# EAGLE design proto1-a (EAGLE 4.13)
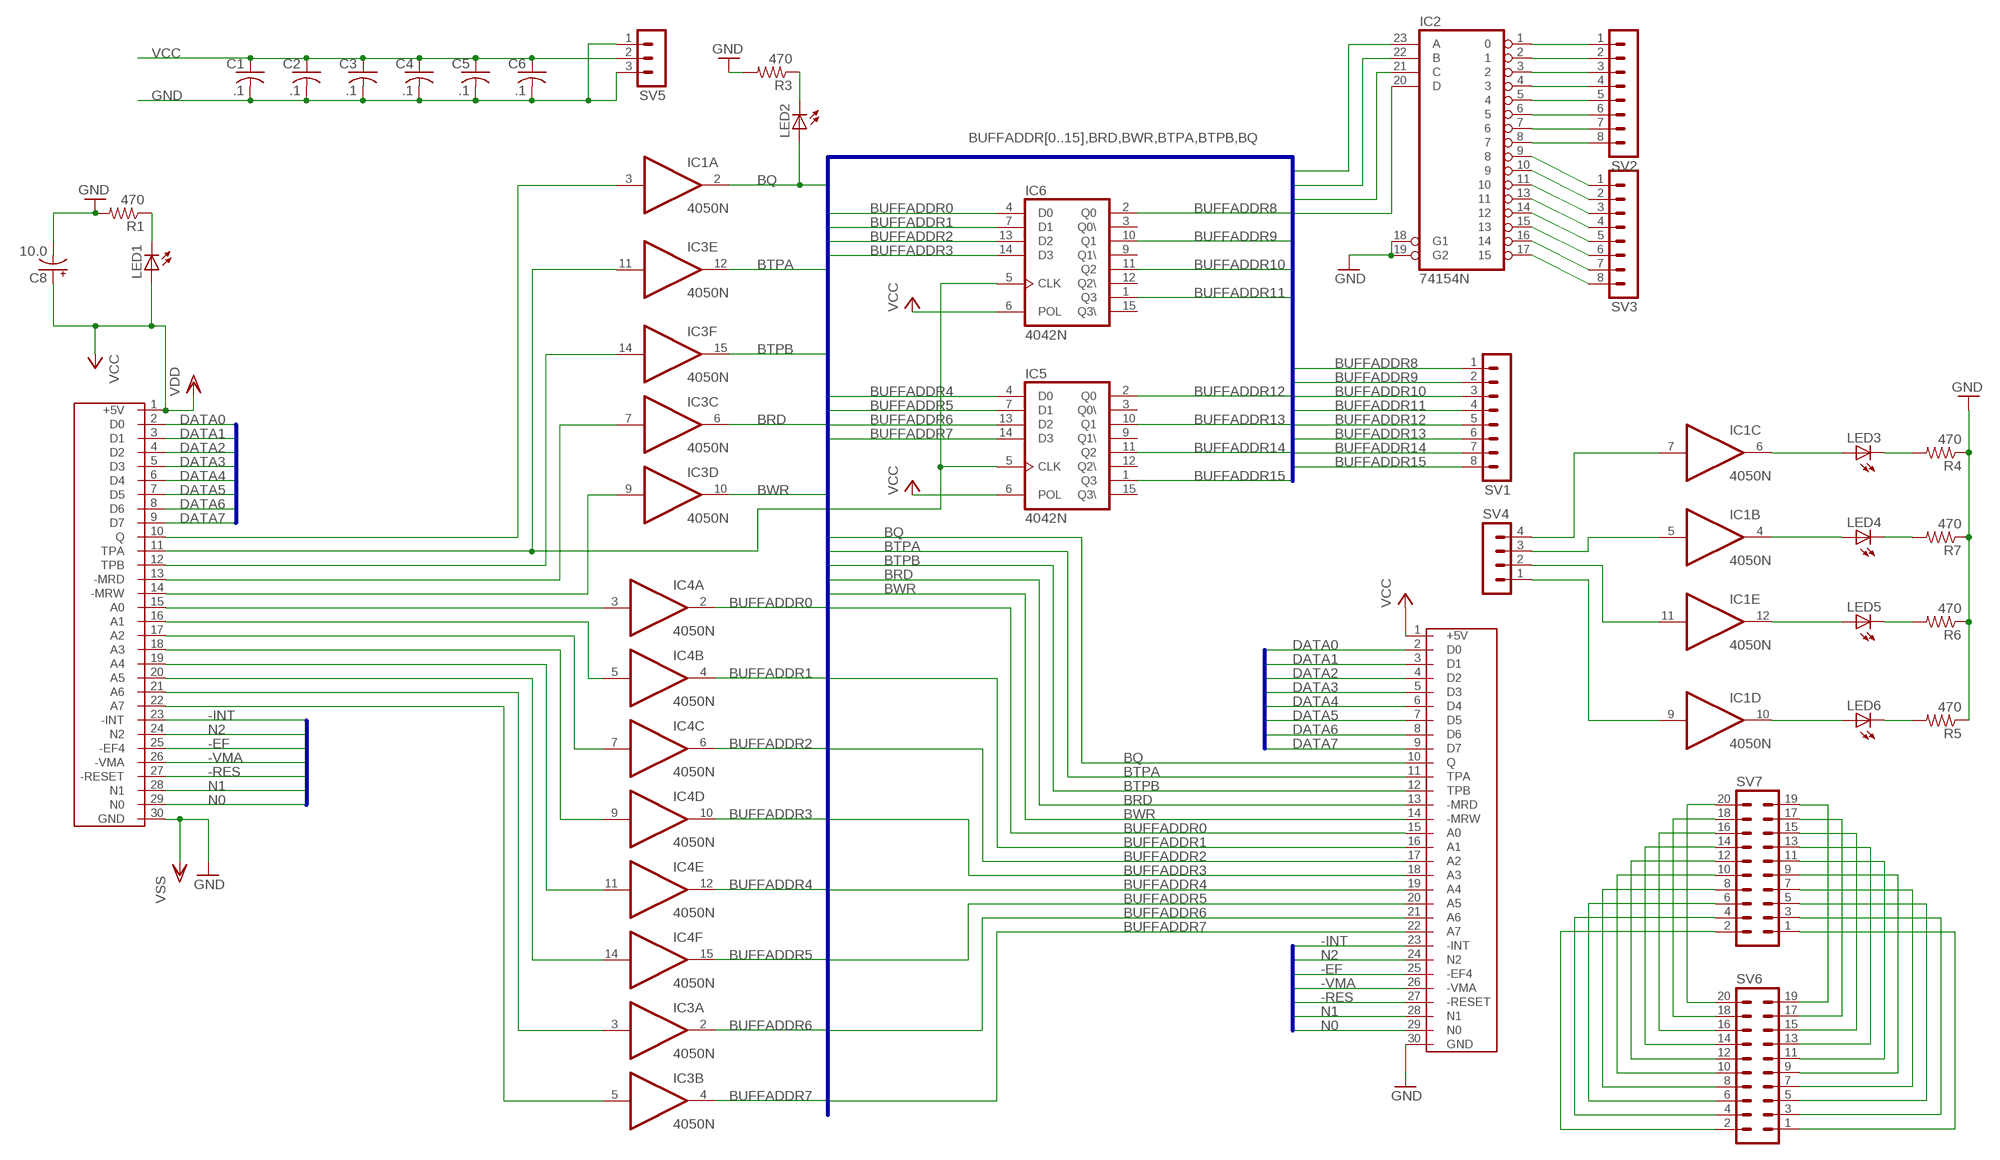
[diagram p0: schematic, sheet 1]

## Parts
C1  .1  C-US025-050X050  [C025-050X050]
C2  .1  C-US025-050X050  [C025-050X050]
C3  .1  C-US025-050X050  [C025-050X050]
C4  .1  C-US025-050X050  [C025-050X050]
C5  .1  C-US025-050X050  [C025-050X050]
C6  .1  C-US025-050X050  [C025-050X050]
C8  10.0  CPOL-USE2.5-7  [E2,5-7]
IC1  4050N  [DIL16]
IC2  74154N  [DIL24-6]
IC3  4050N  [DIL16]
IC4  4050N  [DIL16]
IC5  4042N  [DIL16]
IC6  4042N  [DIL16]
LED1  LED5MM  [LED5MM]
LED2  LED5MM  [LED5MM]
LED3  LED5MM  [LED5MM]
LED4  LED5MM  [LED5MM]
LED5  LED5MM  [LED5MM]
LED6  LED5MM  [LED5MM]
R1  470  R-US_0207/7  [0207/7]
R3  470  R-US_0207/7  [0207/7]
R4  470  R-US_0207/7  [0207/7]
R5  470  R-US_0207/7  [0207/7]
R6  470  R-US_0207/7  [0207/7]
R7  470  R-US_0207/7  [0207/7]
SV1  MA08-1  [MA08-1]
SV2  MA08-1  [MA08-1]
SV3  MA08-1  [MA08-1]
SV4  MA04-1  [MA04-1]
SV5  MA03-1  [MA03-1]
SV6  MA10-2  [MA10-2]
SV7  MA10-2  [MA10-2]
U$1  C30  [C30]
U$2  C30  [C30]

## Nets
-EF: U$1.25(-EF4) U$2.25(-EF4)
-INT: U$1.23(-INT) U$2.23(-INT)
-RES: U$1.27(-RESET) U$2.27(-RESET)
-VMA: U$1.26(-VMA) U$2.26(-VMA)
ADDR0: IC4.3(A:I) U$1.15(A0)
ADDR1: IC4.5(B:I) U$1.16(A1)
ADDR2: IC4.7(C:I) U$1.17(A2)
ADDR3: IC4.9(D:I) U$1.18(A3)
ADDR4: IC4.11(E:I) U$1.19(A4)
ADDR5: IC4.14(F:I) U$1.20(A5)
ADDR6: IC3.3(A:I) U$1.21(A6)
ADDR7: IC3.5(B:I) U$1.22(A7)
BQ: IC1.2(A:O) LED2.A U$2.10(Q)
BRD: IC3.6(C:O) U$2.13(-MRD)
BTPA: IC3.12(E:O) U$2.11(TPA)
BTPB: IC3.15(F:O) U$2.12(TPB)
BUFFADDR0: IC4.2(A:O) IC6.4(D0) U$2.15(A0)
BUFFADDR1: IC4.4(B:O) IC6.7(D1) U$2.16(A1)
BUFFADDR2: IC4.6(C:O) IC6.13(D2) U$2.17(A2)
BUFFADDR3: IC4.10(D:O) IC6.14(D3) U$2.18(A3)
BUFFADDR4: IC4.12(E:O) IC5.4(D0) U$2.19(A4)
BUFFADDR5: IC4.15(F:O) IC5.7(D1) U$2.20(A5)
BUFFADDR6: IC3.2(A:O) IC5.13(D2) U$2.21(A6)
BUFFADDR7: IC3.4(B:O) IC5.14(D3) U$2.22(A7)
BUFFADDR8: IC6.2(Q0) SV1.1
BUFFADDR9: IC6.10(Q1) SV1.2
BUFFADDR10: IC6.11(Q2) SV1.3
BUFFADDR11: IC6.1(Q3) SV1.4
BUFFADDR12: IC2.23(A) IC5.2(Q0) SV1.5
BUFFADDR13: IC2.22(B) IC5.10(Q1) SV1.6
BUFFADDR14: IC2.21(C) IC5.11(Q2) SV1.7
BUFFADDR15: IC2.20(D) IC5.1(Q3) SV1.8
BWR: IC3.10(D:O) U$2.14(-MRW)
DATA0: U$1.2(D0) U$2.2(D0)
DATA1: U$1.3(D1) U$2.3(D1)
DATA2: U$1.4(D2) U$2.4(D2)
DATA3: U$1.5(D3) U$2.5(D3)
DATA4: U$1.6(D4) U$2.6(D4)
DATA5: U$1.7(D5) U$2.7(D5)
DATA6: U$1.8(D6) U$2.8(D6)
DATA7: U$1.9(D7) U$2.9(D7)
GND: C1.2 C2.2 C3.2 C4.2 C5.2 C6.2 C8.- IC2.18(G1) IC2.19(G2) R1.2 R3.2 R4.1 R5.1 R6.1 R7.1 SV5.1 SV5.3 U$1.30(GND) U$2.30(GND) ; supply symbol labelled VSS
N0: U$1.29(N0) U$2.29(N0)
N1: U$1.28(N1) U$2.28(N1)
N2: U$1.24(N2) U$2.24(N2)
N$1: IC1.3(A:I) U$1.10(Q)
N$2: IC2.6 SV2.6
N$3: IC2.7 SV2.7
N$4: IC2.1 SV2.1
N$5: IC2.2 SV2.2
N$6: IC2.3 SV2.3
N$7: IC2.4 SV2.4
N$8: IC2.5 SV2.5
N$9: IC2.8 SV2.8
N$10: IC2.9 SV3.1
N$11: IC3.11(E:I) IC5.5(CLK) IC6.5(CLK) U$1.11(TPA)
N$12: IC3.14(F:I) U$1.12(TPB)
N$13: IC3.7(C:I) U$1.13(-MRD)
N$14: IC3.9(D:I) U$1.14(-MRW)
N$15: IC2.10 SV3.2
N$16: IC2.11 SV3.3
N$17: IC2.13 SV3.4
N$18: IC2.14 SV3.5
N$19: IC2.15 SV3.6
N$20: IC2.16 SV3.7
N$21: IC2.17 SV3.8
N$22: LED1.K(C) R1.1
N$23: LED2.K(C) R3.1
N$24: IC1.6(C:O) LED3.A
N$25: LED3.K(C) R4.2
N$26: LED4.K(C) R7.2
N$27: IC1.4(B:O) LED4.A
N$28: IC1.12(E:O) LED5.A
N$29: LED5.K(C) R6.2
N$30: IC1.10(D:O) LED6.A
N$31: LED6.K(C) R5.2
N$32: IC1.7(C:I) SV4.4
N$33: IC1.5(B:I) SV4.3
N$34: IC1.11(E:I) SV4.2
N$35: IC1.9(D:I) SV4.1
N$36: SV6.19 SV7.19
N$37: SV6.17 SV7.17
N$38: SV6.15 SV7.15
N$39: SV6.13 SV7.13
N$40: SV6.11 SV7.11
N$41: SV6.5 SV7.5
N$42: SV6.9 SV7.9
N$43: SV6.7 SV7.7
N$44: SV6.3 SV7.3
N$45: SV6.1 SV7.1
N$46: SV6.20 SV7.20
N$47: SV6.18 SV7.18
N$48: SV6.16 SV7.16
N$49: SV6.14 SV7.14
N$50: SV6.12 SV7.12
N$51: SV6.10 SV7.10
N$52: SV6.8 SV7.8
N$53: SV6.6 SV7.6
N$54: SV6.4 SV7.4
N$55: SV6.2 SV7.2
VCC: C1.1 C2.1 C3.1 C4.1 C5.1 C6.1 C8.+ IC5.6(POL) IC6.6(POL) LED1.A SV5.2 U$1.1(+5V) U$2.1(+5V) ; supply symbol labelled VDD
Unconnected: IC1.14(F:I) IC1.15(F:O) IC5.3(Q0\) IC5.9(Q1\) IC5.12(Q2\) IC5.15(Q3\) IC6.3(Q0\) IC6.9(Q1\) IC6.12(Q2\) IC6.15(Q3\)

## Buses
BUFFADDR[0..15],BRD,BWR,BTPA,BTPB,BQ
DATA[0..7]
-INT,N0,N1,N2,-EF,-VMA,-RES,-VMA

## Power pins joined to a net without a drawn wire
GND: IC2.12(GND)
VCC: IC2.24(VCC)
VDD: IC1.1(P:VDD) IC3.1(P:VDD) IC4.1(P:VDD) IC5.16(VDD) IC6.16(VDD)
VSS: IC1.8(P:VSS) IC3.8(P:VSS) IC4.8(P:VSS) IC5.8(VSS) IC6.8(VSS)

## Library data of the parts
C1-C6 = rcl:C-US: CAPACITOR, American symbol
C8 = rcl:CPOL-US: POLARIZED CAPACITOR, American symbol
IC1 IC3 IC4 = 40xx:4050: Hex non-inverting BUFFER
IC2 = 74xx-us:74*154: 4-line to 16-line data SELECTOR/MULTIPLEXER
IC5 IC6 = 40xx:4042: Quad clocked D LATCH
LED1-LED6 = led:LED: LED OSRAM: - CHIPLED LG R971, LG N971, LY N971, LG Q971, LY Q971, LO R971, LY R971 LH N974, LH R974 LS Q976, LO Q976, LY Q976 LO Q996 - Hyper CHIPLED LW Q18S LB Q993, LB Q99A, LB R99A - SideLED LS A670, LO A670, LY A670, LG A670, LP A670 LB A673, LV A673, LT A673, LW A673 LH A674 LY A675 LS A676, LA A676, LO A676, LY A676, LW A676 LS A679, LY A679, LG A679 - Hyper Micro SIDELED® LS Y876, LA Y876, LO Y876, LY Y876 LT Y87S - SmartLED LW L88C, LW L88S LB L89C, LB L89S, LG L890 LS L89K, LO L89K, LY L89K LS L896, LA L896, LO L896, LY L896 - TOPLED LS T670, LO T670, LY T670, LG T670, LP T670 LSG T670, LSP T670, LSY T670, LOP T670, LYG T670 LG T671, LOG T671, LSG T671 LB T673, LV T673, LT T673, LW T673 LH T674 LS T676, LA T676, LO T676, LY T676, LB T676, LH T676, LSB T676, LW T676 LB T67C, LV T67C, LT T67C, LS T67K, LO T67K, LY T67K, LW E67C LS E67B, LA E67B, LO E67B, LY E67B, LB E67C, LV E67C, LT E67C LW T67C LS T679, LY T679, LG T679 LS T770, LO T770, LY T770, LG T770, LP T770 LB T773, LV T773, LT T773, LW T773 LH T774 LS E675, LA E675, LY E675, LS T675 LS T776, LA T776, LO T776, LY T776, LB T776 LHGB T686 LT T68C, LB T68C - Hyper Mini TOPLED® LB M676 - Mini TOPLED Santana® LG M470 LS M47K, LO M47K, LY M47K Source: http://www.osram.convergy.de/
R1 R3-R7 = rcl:R-US_: RESISTOR, American symbol
SV1-SV3 = con-lstb:MA08-1: PIN HEADER
SV4 = con-lstb:MA04-1: PIN HEADER
SV5 = con-lstb:MA03-1: PIN HEADER
SV6 SV7 = con-lstb:MA10-2: PIN HEADER
U$1 U$2 = k1:C30

## Board
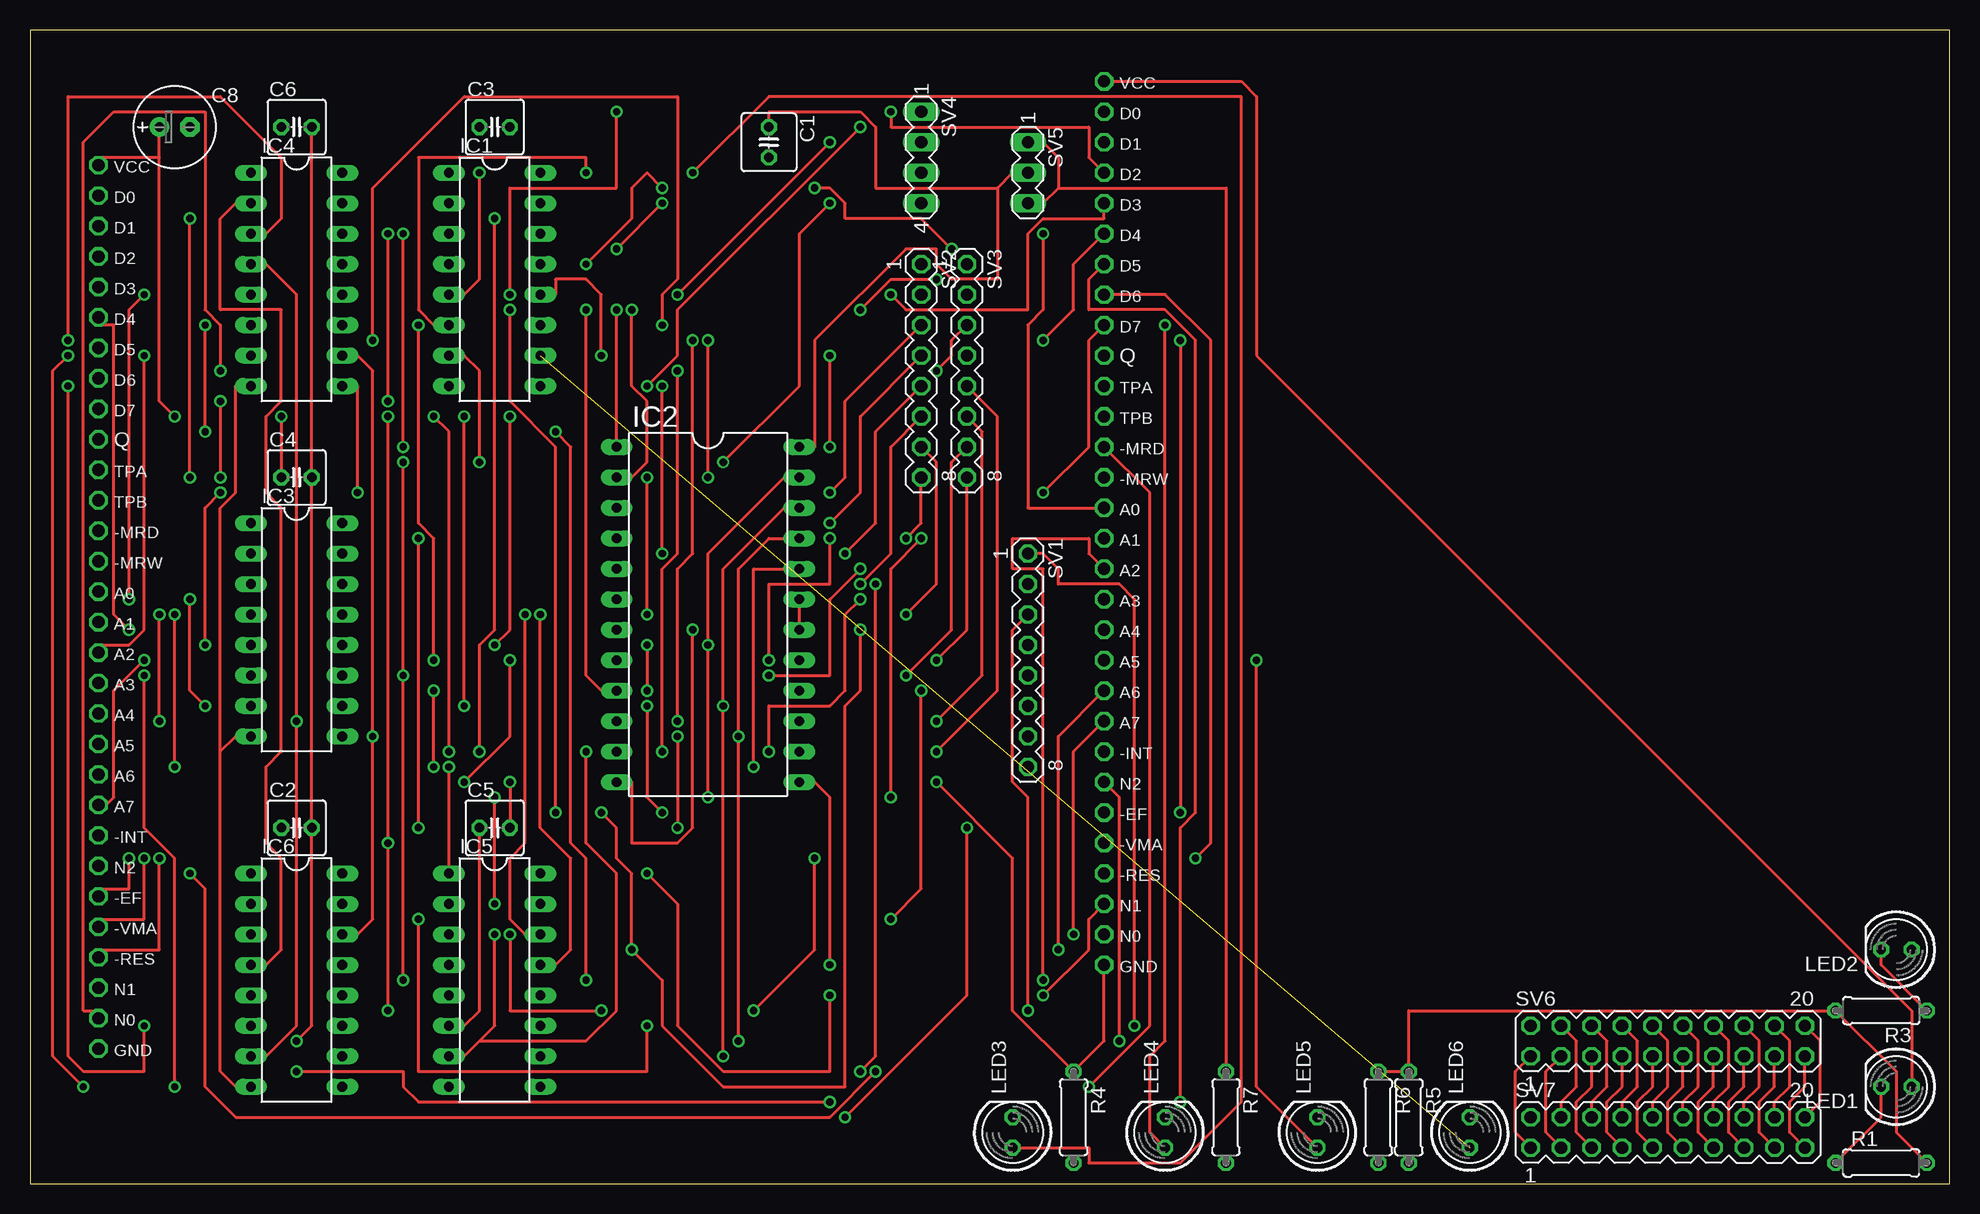
[diagram p1: board, top side]
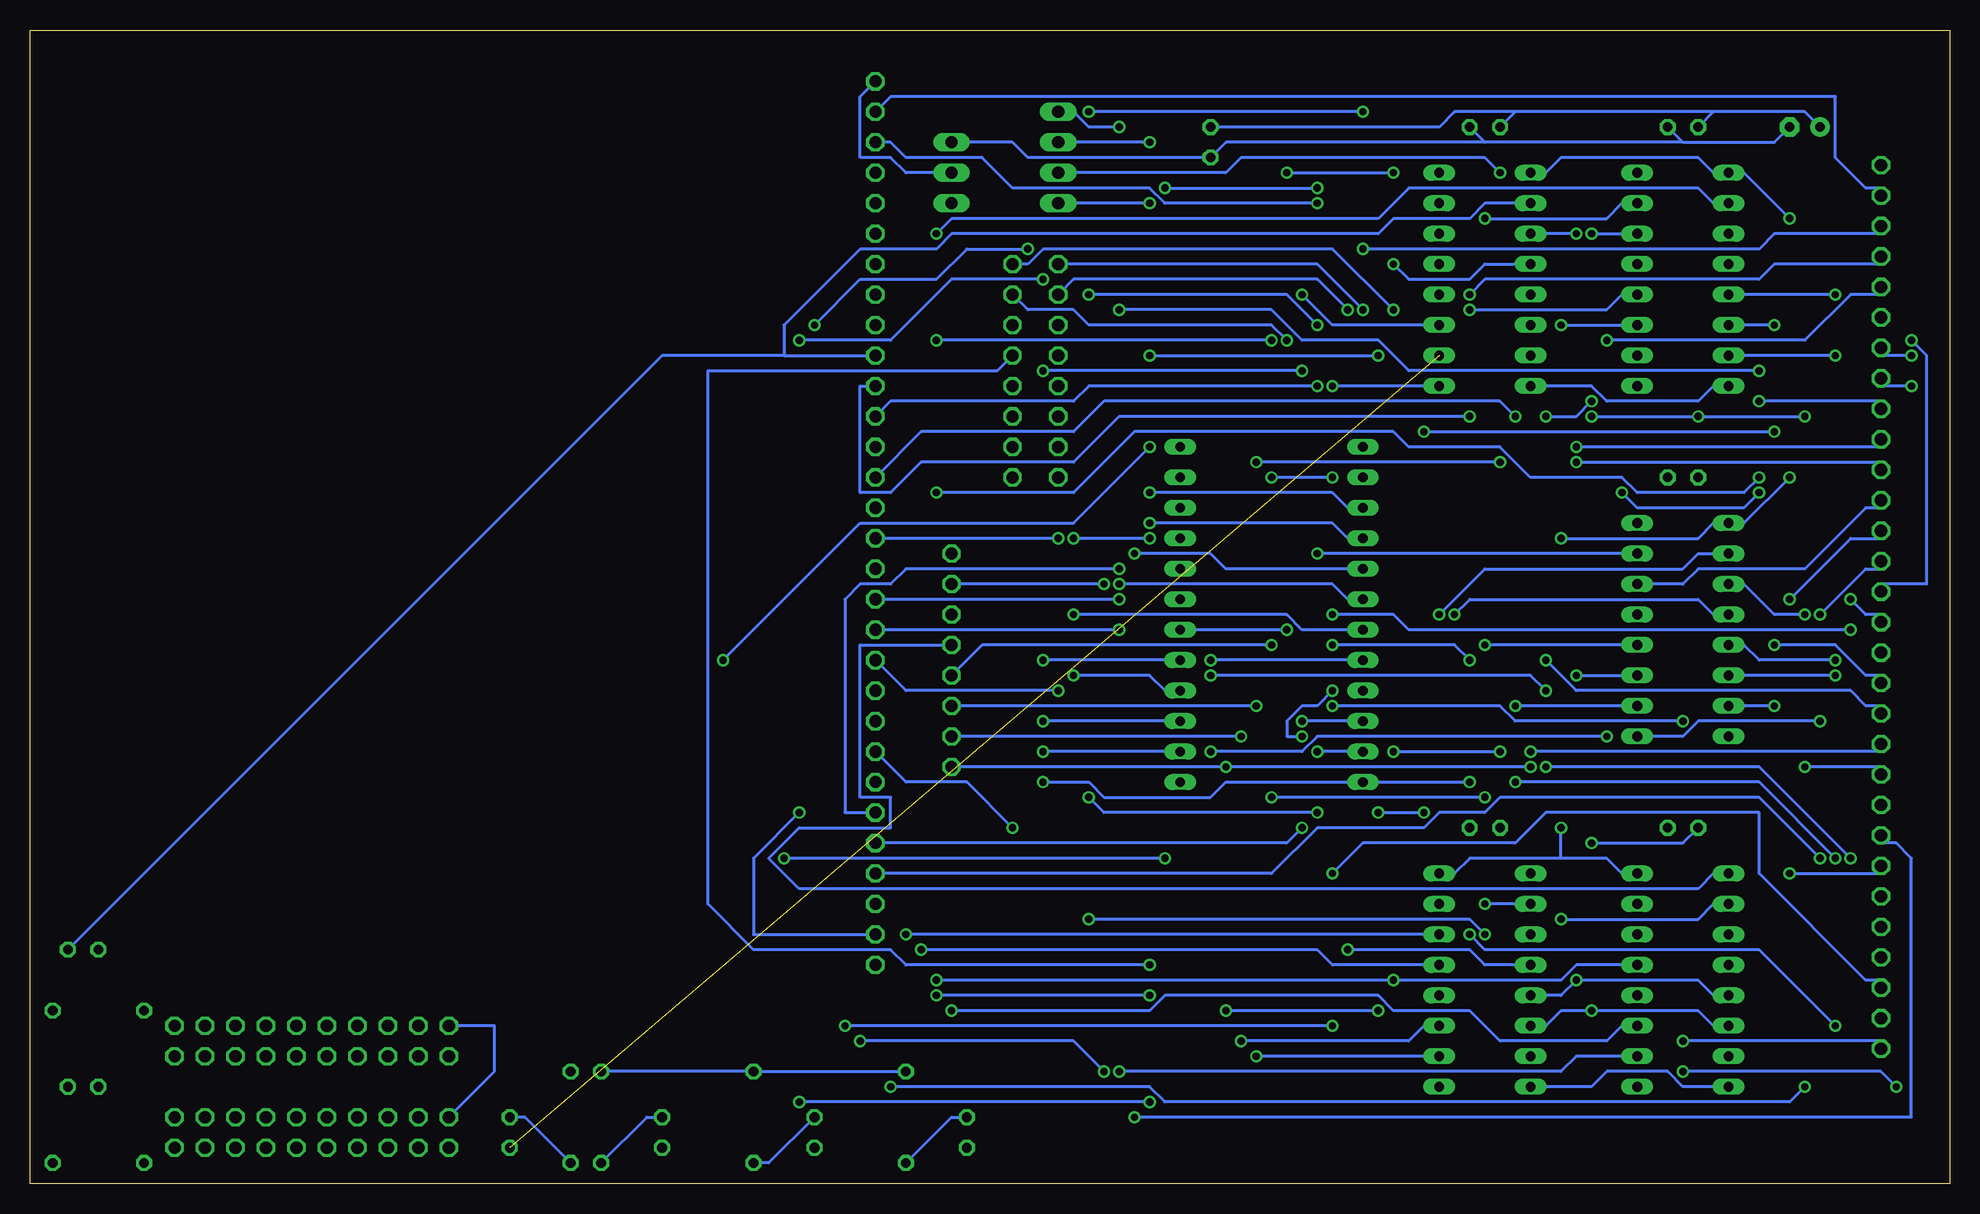
[diagram p2: board, bottom side, seen from below]

Size 160 x 96.19 mm. Coordinates in mm from the lower left corner, seen from the top.
Outline: 0,0 160,0 160,96.19 0,96.19 0,0
Copper layers (1*16): Top 0.035mm / dielectric 1.5mm / Bottom 0.035mm
Design rules "default": minimum track width 10mil, minimum drill 24mil, track to track 8mil, track to pad 8mil, pad to pad 8mil, via to via 8mil, smd to smd 8mil, copper to edge 40mil, drill to drill 8mil, minimum pad ring 10mil, minimum via ring 8mil, stop-mask expansion 4mil, vias tented up to drill 0mil, thermal gap 10mil
tRestrict: area 0.6,91.9 to 76.8,95.7; area 0.6,0.5 to 76.8,4.3
bRestrict: area 0.6,91.9 to 76.8,95.7; area 0.6,0.5 to 76.8,4.3

### Footprints (pad centres in the part's own frame; a part is rotated, then mirrored left to right if it is on the bottom)
C025-050X050 = drill 0.813 octagon: 1 -1.27,0; 2 1.27,0
E2,5-7 = drill 0.813 pad 1.6 round: + -1.27,0 | drill 0.813 pad 1.6 octagon: - 1.27,0
DIL16 = drill 0.813 long: 1 -8.89,-3.81; 2 -6.35,-3.81; 3 -3.81,-3.81; 4 -1.27,-3.81; 5 1.27,-3.81; 6 3.81,-3.81; 7 6.35,-3.81; 8 8.89,-3.81; 9 8.89,3.81; 10 6.35,3.81; 11 3.81,3.81; 12 1.27,3.81; 13 -1.27,3.81; 14 -3.81,3.81; 15 -6.35,3.81; 16 -8.89,3.81
DIL24-6 = drill 0.813 long: 1 -13.97,-7.62; 2 -11.43,-7.62; 3 -8.89,-7.62; 4 -6.35,-7.62; 5 -3.81,-7.62; 6 -1.27,-7.62; 7 1.27,-7.62; 8 3.81,-7.62; 9 6.35,-7.62; 10 8.89,-7.62; 11 11.43,-7.62; 12 13.97,-7.62; 13 13.97,7.62; 14 11.43,7.62; 15 8.89,7.62; 16 6.35,7.62; 17 3.81,7.62; 18 1.27,7.62; 19 -1.27,7.62; 20 -3.81,7.62; 21 -6.35,7.62; 22 -8.89,7.62; 23 -11.43,7.62; 24 -13.97,7.62
LED5MM = drill 0.813 octagon: A -1.27,0; K 1.27,0
0207/7 = drill 0.813 octagon: 1 -3.81,0; 2 3.81,0
MA08-1 = drill 1.016 octagon: 1 -8.89,0; 2 -6.35,0; 3 -3.81,0; 4 -1.27,0; 5 1.27,0; 6 3.81,0; 7 6.35,0; 8 8.89,0
MA04-1 = drill 1.016 long: 1 -3.81,0; 2 -1.27,0; 3 1.27,0; 4 3.81,0
MA03-1 = drill 1.016 long: 1 -2.54,0; 2 0,0; 3 2.54,0
MA10-2 = drill 1.016 octagon: 1 -11.43,-1.27; 2 -11.43,1.27; 3 -8.89,-1.27; 4 -8.89,1.27; 5 -6.35,-1.27; 6 -6.35,1.27; 7 -3.81,-1.27; 8 -3.81,1.27; 9 -1.27,-1.27; 10 -1.27,1.27; 11 1.27,-1.27; 12 1.27,1.27; 13 3.81,-1.27; 14 3.81,1.27; 15 6.35,-1.27; 16 6.35,1.27; 17 8.89,-1.27; 18 8.89,1.27; 19 11.43,-1.27; 20 11.43,1.27
C30 = drill 1.016 octagon: 1 -36.83,0; 2 -34.29,0; 3 -31.75,0; 4 -29.21,0; 5 -26.67,0; 6 -24.13,0; 7 -21.59,0; 8 -19.05,0; 9 -16.51,0; 10 -13.97,0; 11 -11.43,0; 12 -8.89,0; 13 -6.35,0; 14 -3.81,0; 15 -1.27,0; 16 1.27,0; 17 3.81,0; 18 6.35,0; 19 8.89,0; 20 11.43,0; 21 13.97,0; 22 16.51,0; 23 19.05,0; 24 21.59,0; 25 24.13,0; 26 26.67,0; 27 29.21,0; 28 31.75,0; 29 34.29,0; 30 36.83,0

### Placement (x,y rotation side)
C1  61.59,86.83 270 top
C2  22.22,29.68 0 top
C3  38.73,88.1 0 top
C4  22.22,58.89 0 top
C5  38.73,29.68 0 top
C6  22.22,88.1 0 top
C8  12.06,88.1 0 top
IC1  38.73,75.4 270 top
IC2  56.51,47.46 270 top
IC3  22.22,46.19 270 top
IC4  22.22,75.4 270 top
IC5  38.73,16.98 270 top
IC6  22.22,16.98 270 top
LED1  155.57,8.09 180 top
LED2  155.57,19.52 180 top
LED3  81.91,4.28 90 top
LED4  94.61,4.28 90 top
LED5  107.31,4.28 90 top
LED6  120.01,4.28 90 top
R1  154.3,1.74 0 top
R3  154.3,14.44 180 top
R4  86.99,5.55 270 top
R5  114.93,5.55 270 top
R6  112.39,5.55 270 top
R7  99.69,5.55 270 top
SV1  83.18,43.65 270 top
SV2  74.29,67.78 270 top
SV3  78.1,67.78 270 top
SV4  74.29,85.56 270 top
SV5  83.18,84.29 270 top
SV6  136.52,11.9 0 top
SV7  136.52,4.28 0 top
U$1  5.71,48.09 270 top
U$2  89.53,55.08 270 top

### Tracks (layer width: path | path; a pad name or v marks a point on that pad's centre or on a via)
-EF  (via drill 0.61)
  Top 0.254: v8.25,27.14 8.25,24.6 5.71,24.6 U$1.25 | v33.65,34.76 v33.65,41.11 | v61.59,42.38 66.67,42.38 66.67,48.73 v69.21,51.27
  Bottom 0.254: v8.25,27.14 15.87,34.76 v33.65,34.76 | v33.65,41.11 34.92,42.38 v61.59,42.38 | v69.21,51.27 86.99,51.27 88.26,50 90.8,50 92.07,48.73 92.07,30.95 U$2.25
-INT  (via drill 0.61)
  Top 0.254: v67.94,5.55 78.1,15.71 v78.1,29.68
  Bottom 0.254: v67.94,5.55 3.17,5.55 3.17,27.14 4.44,28.41 5.71,28.41 U$1.23 | v78.1,29.68 81.91,33.49 86.99,33.49 U$2.23
-RES  (via drill 0.61)
  Top 0.254: v10.79,27.14 10.79,19.52 5.71,19.52 U$1.27
  Bottom 0.254: v10.79,27.14 15.87,32.22 37.46,32.22 38.73,30.95 42.54,30.95 43.81,29.68 52.7,29.68 56.51,25.87 U$2.27
-VMA  (via drill 0.61)
  Top 0.254: v9.52,27.14 9.52,22.06 5.71,22.06 U$1.26 | v36.19,33.49 40,37.3 v40,43.65 | v51.43,44.92 v51.43,41.11 | v53.97,37.3 v53.97,29.68
  Bottom 0.254: v9.52,27.14 15.87,33.49 v36.19,33.49 | v40,43.65 41.27,44.92 v51.43,44.92 | v51.43,41.11 52.7,39.84 53.97,39.84 55.24,38.57 55.24,37.3 v53.97,37.3 | v53.97,29.68 55.24,28.41 U$2.26
ADDR0  (via drill 0.61)
  Top 0.254: v3.17,70.32 3.17,90.64 15.87,90.64 20.95,85.56 20.95,80.48 19.68,79.21 IC4.3
  Bottom 0.254: v3.17,70.32 1.9,69.05 1.9,50 5.71,50 U$1.15
ADDR1  (via drill 0.61)
  Top 0.254: v9.52,74.13 8.25,72.86 v8.25,48.73
  Bottom 0.254: v8.25,48.73 6.98,47.46 5.71,47.46 U$1.16 | v9.52,74.13 IC4.5
ADDR2  (via drill 0.61)
  Top 0.254: v9.52,69.05 9.52,46.19 8.25,44.92 5.71,44.92 U$1.17
  Bottom 0.254: v9.52,69.05 IC4.7
ADDR3  (via drill 0.61)
  Top 0.254: v27.3,57.62 27.3,66.51 IC4.9 | v15.87,57.62 14.6,56.35 v14.6,44.92
  Bottom 0.254: v27.3,57.62 26.03,56.35 17.14,56.35 v15.87,57.62 | v14.6,44.92 9.52,44.92 6.98,42.38 5.71,42.38 U$1.18
ADDR4  (via drill 0.61)
  Top 0.254: v32.38,71.59 32.38,55.08 33.65,53.81 v33.65,43.65
  Bottom 0.254: v33.65,43.65 31.11,41.11 8.25,41.11 6.98,39.84 5.71,39.84 U$1.19 | v32.38,71.59 IC4.11
ADDR5  (via drill 0.61)
  Top 0.254: v29.84,65.24 v29.84,79.21 | v33.65,63.97 34.92,62.7 v34.92,36.03
  Bottom 0.254: v29.84,65.24 31.11,63.97 v33.65,63.97 | v34.92,36.03 5.71,36.03 U$1.20 | v29.84,79.21 IC4.14
ADDR6  (via drill 0.61)
  Top 0.254: v12.06,34.76 v12.06,47.46
  Bottom 0.254: v12.06,47.46 14.6,47.46 17.14,50 IC3.3 | v12.06,34.76 5.71,34.76 U$1.21
ADDR7  (via drill 0.61)
  Top 0.254: v9.52,43.65 6.98,41.11 6.98,32.22 5.71,30.95 U$1.22
  Bottom 0.254: v9.52,43.65 15.87,43.65 17.14,44.92 IC3.5
BQ
  Bottom 0.254: 97.15,69.05 97.15,71.59 90.8,77.94 84.45,77.94 83.18,79.21 47.62,79.21 46.35,80.48 40,80.48 38.73,81.75 IC1.2 | 97.15,69.05 U$2.10 | LED2.A 107.31,69.05 97.15,69.05
BRD  (via drill 0.61)
  Top 0.254: v9.52,42.38 9.52,29.68 12.06,27.14 v12.06,8.09 | v88.26,8.09 93.34,13.17 93.34,57.62 U$2.13
  Bottom 0.254: v12.06,8.09 13.33,6.82 65.4,6.82 66.67,8.09 v88.26,8.09 | v9.52,42.38 IC3.6
BTPA  (via drill 0.61)
  Top 0.254: v38.73,44.92 40,46.19 v40,63.97
  Bottom 0.254: v40,63.97 69.21,63.97 73.02,60.16 85.72,60.16 88.26,57.62 90.8,57.62 90.8,66.51 U$2.11 | IC3.12 v38.73,44.92
BTPB  (via drill 0.61)
  Top 0.254: v52.7,52.54 v52.7,66.51
  Bottom 0.254: v52.7,66.51 71.75,66.51 73.02,65.24 88.26,65.24 U$2.12 | IC3.15 v52.7,52.54
BUFFADDR0  (via drill 0.61)
  Top 0.254: IC6.4 19.68,18.25 20.95,19.52 20.95,27.14 19.68,28.41 19.68,34.76 20.95,36.03 20.95,56.35 19.68,57.62 19.68,63.97 20.95,65.24 20.95,72.86 15.87,72.86 15.87,80.48 17.14,81.75 IC4.2 | U$2.15 83.18,56.35 83.18,71.59 84.45,72.86 v84.45,79.21
  Bottom 0.254: v84.45,79.21 83.18,80.48 47.62,80.48 45.08,83.02 20.95,83.02 19.68,81.75 IC4.2
BUFFADDR1  (via drill 0.61)
  Top 0.254: IC6.7 19.68,10.63 22.22,13.17 v22.22,38.57 22.22,74.13 19.68,76.67 IC4.4 | v74.29,53.81 71.75,51.27 v71.75,32.22 | v52.7,30.95 51.43,32.22 v51.43,39.84
  Bottom 0.254: v74.29,53.81 U$2.16 | v71.75,32.22 70.48,30.95 v52.7,30.95 | v51.43,39.84 37.46,39.84 36.19,38.57 v22.22,38.57
BUFFADDR2  (via drill 0.61)
  Top 0.254: v84.45,16.98 84.45,51.27 81.91,51.27 81.91,53.81 88.26,53.81 88.26,52.54 U$2.17 | v14.6,62.7 v14.6,71.59 | v43.81,62.7 45.08,61.43 45.08,28.41 46.35,27.14 v46.35,16.98
  Bottom 0.254: v84.45,16.98 v46.35,16.98 32.38,16.98 31.11,18.25 IC6.13 | v43.81,62.7 v14.6,62.7 | v14.6,71.59 IC4.6
BUFFADDR3  (via drill 0.61)
  Top 0.254: IC6.14 27.3,20.79 28.57,22.06 v28.57,37.3 28.57,67.78 27.3,69.05 IC4.10 | v69.21,48.73 67.94,47.46 67.94,41.11 66.67,39.84 61.59,39.84 v61.59,36.03
  Bottom 0.254: v69.21,48.73 U$2.18 | v61.59,36.03 53.97,36.03 52.7,37.3 v28.57,37.3
BUFFADDR4  (via drill 0.61)
  Top 0.254: v69.21,46.19 69.21,41.11 67.94,39.84 67.94,8.09 57.78,8.09 52.7,13.17 52.7,16.98 v50.16,19.52 50.16,25.87 48.89,27.14 48.89,29.68 v47.62,30.95 | v40,72.86 40,65.24 43.81,61.43 v43.81,30.95
  Bottom 0.254: v50.16,19.52 40,19.52 38.73,18.25 IC5.4 | v69.21,46.19 U$2.19 | v40,72.86 28.57,72.86 27.3,74.13 IC4.12 | v47.62,30.95 v43.81,30.95
BUFFADDR5  (via drill 0.61)
  Top 0.254: 37.46,11.9 38.73,13.17 v38.73,20.79 | 37.46,11.9 36.19,10.63 IC5.7 | v71.75,22.06 74.29,24.6 v74.29,41.11 | v38.73,80.48 38.73,46.19 37.46,44.92 v37.46,36.03 | v46.35,36.03 46.35,28.41 48.89,25.87 48.89,14.44 46.35,11.9 37.46,11.9
  Bottom 0.254: v38.73,20.79 40,22.06 v71.75,22.06 | v74.29,41.11 86.99,41.11 U$2.20 | v38.73,80.48 28.57,80.48 27.3,81.75 IC4.15 | v46.35,36.03 v37.46,36.03
BUFFADDR6  (via drill 0.61)
  Top 0.254: v42.54,47.46 42.54,29.68 45.08,27.14 45.08,19.52 43.81,18.25 IC5.13 | U$2.21 85.72,37.3 v85.72,19.52
  Bottom 0.254: v42.54,47.46 38.73,51.27 22.22,51.27 20.95,52.54 IC3.2 | v85.72,19.52 52.7,19.52 51.43,18.25 IC5.13
BUFFADDR7  (via drill 0.61)
  Top 0.254: v86.99,20.79 86.99,36.03 U$2.22 | v41.27,47.46 41.27,28.41 40,27.14 40,22.06 41.27,20.79 IC5.14
  Bottom 0.254: IC5.14 v86.99,20.79 | v41.27,47.46 40,48.73 20.95,48.73 19.68,47.46 IC3.4
BUFFADDR8  (via drill 0.61)
  Top 0.254: v32.38,22.06 32.38,9.36 51.43,9.36 v51.43,13.17 | v92.07,13.17 92.07,48.73 90.8,50 85.72,50 85.72,51.27 84.45,52.54 SV1.1
  Bottom 0.254: v32.38,22.06 20.95,22.06 19.68,23.33 IC6.2 | v51.43,13.17 v92.07,13.17
BUFFADDR9  (via drill 0.61)
  Top 0.254: v69.21,9.36 70.48,10.63 v70.48,50
  Bottom 0.254: v69.21,9.36 32.38,9.36 31.11,10.63 IC6.10 | v70.48,50 SV1.2
BUFFADDR10  (via drill 0.61)
  Top 0.254: v83.18,14.44 83.18,32.22 81.91,33.49 81.91,46.19 SV1.3
  Bottom 0.254: v83.18,14.44 66.67,14.44 65.4,15.71 47.62,15.71 46.35,14.44 40,14.44 37.46,11.9 28.57,11.9 27.3,13.17 IC6.11
BUFFADDR11
  Bottom 0.254: SV1.4 90.8,44.92 90.8,32.22 88.26,32.22 88.26,29.68 95.88,29.68 98.42,27.14 95.88,24.6 20.95,24.6 19.68,25.87 IC6.1
BUFFADDR12  (via drill 0.61)
  Top 0.254: v38.73,23.33 v38.73,32.22 | v56.51,32.22 v56.51,44.92 56.51,52.54 62.86,58.89 IC2.23
  Bottom 0.254: v38.73,32.22 v56.51,32.22 | IC5.2 v38.73,23.33 | SV1.5 80.64,44.92 v56.51,44.92
BUFFADDR13  (via drill 0.61)
  Top 0.254: v57.78,10.63 v57.78,39.84 57.78,51.27 62.86,56.35 IC2.22
  Bottom 0.254: IC5.10 v57.78,10.63 | v57.78,39.84 SV1.6
BUFFADDR14  (via drill 0.61)
  Top 0.254: v59.05,11.9 v59.05,37.3 59.05,51.27 61.59,53.81 IC2.21
  Bottom 0.254: v59.05,11.9 45.08,11.9 43.81,13.17 IC5.11 | v59.05,37.3 SV1.7
BUFFADDR15  (via drill 0.61)
  Top 0.254: IC5.1 v34.92,34.76 | v60.32,34.76 60.32,51.27 IC2.20
  Bottom 0.254: SV1.8 v60.32,34.76 v34.92,34.76
BWR  (via drill 0.61)
  Top 0.254: v36.19,39.84 v36.19,63.97
  Bottom 0.254: v36.19,63.97 37.46,65.24 70.48,65.24 73.02,62.7 85.72,62.7 U$2.14 | IC3.10 v36.19,39.84
DATA0
  Bottom 0.254: U$2.2 88.26,90.64 9.52,90.64 9.52,85.56 6.98,83.02 5.71,83.02 U$1.2
DATA1  (via drill 0.61)
  Top 0.254: v48.89,77.94 v52.7,81.75
  Bottom 0.254: v48.89,77.94 15.87,77.94 14.6,79.21 5.71,79.21 U$1.3 | v52.7,81.75 65.4,81.75 66.67,83.02 78.1,83.02 80.64,85.56 86.99,85.56 88.26,86.83 U$2.3
DATA2  (via drill 0.61)
  Top 0.254: v40,74.13 40,83.02 48.89,83.02 v48.89,89.37 | v71.75,89.37 71.75,88.1 88.26,88.1 88.26,85.56 U$2.4
  Bottom 0.254: v40,74.13 38.73,75.4 15.87,75.4 14.6,76.67 5.71,76.67 U$1.4 | v48.89,89.37 v71.75,89.37
DATA3  (via drill 0.61)
  Top 0.254: v28.57,70.32 28.57,83.02 36.19,90.64 53.97,90.64 53.97,75.4 52.7,74.13 v52.7,71.59 | v71.75,74.13 73.02,72.86 83.18,72.86 83.18,79.21 84.45,80.48 89.53,80.48 U$2.5
  Bottom 0.254: v28.57,70.32 12.06,70.32 8.25,74.13 5.71,74.13 U$1.5 | v52.7,71.59 55.24,74.13 v71.75,74.13
DATA4  (via drill 0.61)
  Top 0.254: v8.25,46.19 6.98,47.46 6.98,71.59 5.71,71.59 U$1.6 | v51.43,47.46 v51.43,58.89 | v56.51,58.89 v56.51,70.32 | v84.45,70.32 86.99,72.86 86.99,76.67 U$2.6
  Bottom 0.254: v8.25,46.19 45.08,46.19 46.35,47.46 v51.43,47.46 | v51.43,58.89 v56.51,58.89 | v56.51,70.32 v84.45,70.32
DATA5  (via drill 0.61)
  Top 0.254: v3.17,69.05 1.9,67.78 1.9,10.63 v4.44,8.09 | v22.22,9.36 31.11,9.36 31.11,8.09 32.38,6.82 v66.67,6.82 | v95.88,6.82 95.88,29.68 97.15,30.95 97.15,70.32 94.61,72.86 88.26,72.86 88.26,75.4 U$2.7
  Bottom 0.254: v3.17,69.05 5.71,69.05 U$1.7 | v4.44,8.09 5.71,9.36 v22.22,9.36 | v66.67,6.82 v95.88,6.82
DATA6  (via drill 0.61)
  Top 0.254: v3.17,66.51 3.17,10.63 4.44,9.36 9.52,9.36 v9.52,13.17 | v40,20.79 40,14.44 v47.62,14.44 | v60.32,14.44 65.4,19.52 v65.4,27.14 | v97.15,27.14 98.42,28.41 98.42,70.32 94.61,74.13 U$2.8
  Bottom 0.254: v3.17,66.51 5.71,66.51 U$1.8 | v9.52,13.17 15.87,19.52 38.73,19.52 v40,20.79 | v47.62,14.44 v60.32,14.44 | v65.4,27.14 v97.15,27.14
DATA7  (via drill 0.61)
  Top 0.254: v15.87,65.24 v15.87,58.89 | v84.45,57.62 88.26,61.43 88.26,70.32 U$2.9
  Bottom 0.254: v15.87,65.24 5.71,65.24 U$1.9 | v15.87,58.89 17.14,57.62 26.03,57.62 27.3,58.89 34.92,58.89 37.46,61.43 45.08,61.43 46.35,62.7 67.94,62.7 73.02,57.62 v84.45,57.62
GND  (via drill 0.61)
  Top 0.254: v22.22,11.9 23.49,13.17 C2.2 C4.2 C6.2 | 85.72,83.02 84.45,81.75 SV5.3 | 85.72,83.02 85.72,85.56 84.45,86.83 SV5.1 | IC2.18 IC2.19 | v40,33.49 C5.2 | v55.24,46.19 55.24,29.68 53.97,28.41 50.16,28.41 50.16,33.49 IC2.12 | R1.2 155.57,4.28 155.57,9.36 R3.2 114.93,14.44 R5.1 R6.1 | U$2.30 89.53,11.9 R4.1 81.91,14.44 81.91,27.14 v75.56,33.49 | 85.72,83.02 99.69,83.02 R7.1
  Bottom 0.254: v22.22,11.9 5.71,11.9 U$1.30 | C6.2 22.22,86.83 | 22.22,86.83 14.6,86.83 C8.- | 38.73,86.83 C3.2 | 22.22,86.83 38.73,86.83 | 38.73,86.83 60.32,86.83 C1.2 76.83,85.56 78.1,86.83 SV5.1 | v40,33.49 IC2.12 60.32,33.49 61.59,32.22 70.48,32.22 71.75,33.49 v75.56,33.49 | v55.24,46.19 IC2.18 | R4.1 R7.1 R6.1
N0  (via drill 0.61)
  Top 0.254: v15.87,67.78 15.87,71.59 14.6,72.86 14.6,89.37 6.98,89.37 4.44,86.83 4.44,14.44 5.71,14.44 U$1.29 | v69.21,72.86 71.75,75.4 v75.56,75.4 | v95.88,70.32 v95.88,30.95
  Bottom 0.254: v15.87,67.78 45.08,67.78 47.62,70.32 53.97,70.32 56.51,72.86 v69.21,72.86 | v75.56,75.4 83.18,75.4 88.26,70.32 v95.88,70.32 | v95.88,30.95 99.69,27.14 99.69,20.79 U$2.29
N1  (via drill 0.61)
  Top 0.254: v51.43,25.87 53.97,23.33 53.97,13.17 57.78,9.36 66.67,9.36 v66.67,15.71 | v84.45,15.71 88.26,19.52 88.26,22.06 U$2.28
  Bottom 0.254: v51.43,25.87 48.89,28.41 36.19,28.41 33.65,30.95 15.87,30.95 15.87,25.87 6.98,16.98 5.71,16.98 U$1.28 | v66.67,15.71 v84.45,15.71
N2  (via drill 0.61)
  Top 0.254: v13.33,25.87 14.6,24.6 14.6,8.09 17.14,5.55 66.67,5.55 v70.48,9.36 | v90.8,11.9 90.8,32.22 U$2.24
  Bottom 0.254: v13.33,25.87 5.71,25.87 U$1.24 | v70.48,9.36 73.02,11.9 v90.8,11.9
N$1  (via drill 0.61)
  Top 0.254: v31.11,61.43 v31.11,79.21
  Bottom 0.254: v31.11,61.43 5.71,61.43 U$1.10 | v31.11,79.21 IC1.3
N$2  (via drill 0.61)
  Top 0.254: v69.21,50 71.75,52.54 71.75,61.43 SV2.6
  Bottom 0.254: v69.21,50 51.43,50 50.16,48.73 IC2.6
N$3  (via drill 0.61)
  Top 0.254: v73.02,47.46 75.56,50 75.56,60.16 SV2.7
  Bottom 0.254: v73.02,47.46 55.24,47.46 53.97,46.19 IC2.7
N$4  (via drill 0.61)
  Top 0.254: IC2.1 v48.89,72.86
  Bottom 0.254: v48.89,72.86 52.7,76.67 SV2.1
N$5  (via drill 0.61)
  Top 0.254: v50.16,72.86 50.16,66.51 51.43,65.24 51.43,60.16 50.16,58.89 IC2.2
  Bottom 0.254: v50.16,72.86 52.7,75.4 73.02,75.4 SV2.2
N$6  (via drill 0.61)
  Top 0.254: v66.67,57.62 67.94,58.89 67.94,65.24 SV2.3
  Bottom 0.254: v66.67,57.62 51.43,57.62 50.16,56.35 IC2.3
N$7  (via drill 0.61)
  Top 0.254: v66.67,55.08 69.21,57.62 69.21,63.97 SV2.4
  Bottom 0.254: v66.67,55.08 51.43,55.08 50.16,53.81 IC2.4
N$8  (via drill 0.61)
  Top 0.254: v67.94,52.54 70.48,55.08 70.48,62.7 SV2.5
  Bottom 0.254: v67.94,52.54 61.59,52.54 60.32,51.27 IC2.5
N$9  (via drill 0.61)
  Top 0.254: v61.59,43.65 61.59,50 66.67,50 v66.67,53.81 | v73.02,53.81 74.29,55.08 SV2.8
  Bottom 0.254: v66.67,53.81 v73.02,53.81 | IC2.8 v61.59,43.65
N$10  (via drill 0.61)
  Top 0.254: v46.35,72.86 46.35,42.38 47.62,41.11 IC2.9
  Bottom 0.254: v46.35,72.86 51.43,77.94 75.56,77.94 76.83,76.67 SV3.1
N$11  (via drill 0.61)
  Top 0.254: v31.11,16.98 v31.11,42.38 v31.11,60.16
  Bottom 0.254: IC6.5 19.68,15.71 20.95,16.98 v31.11,16.98 32.38,15.71 IC5.5 | v31.11,42.38 IC3.11 | v31.11,60.16 5.71,60.16 U$1.11
N$12
  Bottom 0.254: IC3.14 22.22,50 20.95,51.27 12.06,51.27 6.98,56.35 5.71,56.35 U$1.12
N$13  (via drill 0.61)
  Top 0.254: v14.6,39.84 13.33,41.11 v13.33,48.73
  Bottom 0.254: v13.33,48.73 8.25,53.81 5.71,53.81 U$1.13 | v14.6,39.84 IC3.7
N$14  (via drill 0.61)
  Top 0.254: v10.79,38.57 v10.79,47.46
  Bottom 0.254: v10.79,38.57 20.95,38.57 22.22,37.3 IC3.9 | v10.79,47.46 6.98,51.27 5.71,51.27 U$1.14
N$15  (via drill 0.61)
  Top 0.254: v53.97,38.57 53.97,51.27 55.24,52.54 v55.24,70.32
  Bottom 0.254: v55.24,70.32 56.51,71.59 71.75,71.59 73.02,72.86 76.83,72.86 SV3.2 | IC2.10 v53.97,38.57
N$16  (via drill 0.61)
  Top 0.254: v52.7,36.03 52.7,51.27 53.97,52.54 v53.97,67.78 | v75.56,67.78 76.83,69.05 76.83,70.32 SV3.3
  Bottom 0.254: v53.97,67.78 v75.56,67.78 | IC2.11 v52.7,36.03
N$17  (via drill 0.61)
  Top 0.254: v66.67,18.25 66.67,32.22 65.4,33.49 IC2.13
  Bottom 0.254: v66.67,18.25 86.99,18.25 88.26,19.52 99.69,19.52 103.5,23.33 103.5,67.78 79.37,67.78 SV3.4
N$18  (via drill 0.61)
  Top 0.254: v75.56,36.03 80.64,41.11 80.64,63.97 SV3.5
  Bottom 0.254: IC2.14 v75.56,36.03
N$19  (via drill 0.61)
  Top 0.254: v75.56,38.57 79.37,42.38 79.37,62.7 SV3.6
  Bottom 0.254: IC2.15 v75.56,38.57
N$20  (via drill 0.61)
  Top 0.254: v73.02,42.38 76.83,46.19 76.83,60.16 SV3.7
  Bottom 0.254: v73.02,42.38 66.67,42.38 65.4,41.11 IC2.16
N$21  (via drill 0.61)
  Top 0.254: v75.56,43.65 78.1,46.19 SV3.8
  Bottom 0.254: IC2.17 v75.56,43.65
N$22
  Top 0.254: R1.1 154.3,5.55 LED1.K
N$23
  Top 0.254: R3.1 154.3,18.25 LED2.K
N$24  (via drill 0.61)
  Top 0.254: v46.35,84.29 46.35,85.56 32.38,85.56 32.38,72.86 33.65,71.59 IC1.6 | v55.24,84.29 61.59,90.64 100.96,90.64 100.96,6.82 95.88,1.74 88.26,1.74 88.26,3.01 LED3.A
  Bottom 0.254: v55.24,84.29 v46.35,84.29
N$25
  Bottom 0.254: R4.2 83.18,5.55 LED3.K
N$26
  Bottom 0.254: LED4.K 98.42,1.74 R7.2
N$27  (via drill 0.61)
  Top 0.254: LED4.A 93.34,4.28 93.34,10.63 94.61,11.9 v94.61,71.59 | v76.83,77.94 74.29,80.48 67.94,80.48 67.94,81.75 66.67,83.02 v65.4,83.02 | v52.7,83.02 51.43,84.29 50.16,83.02 50.16,80.48 v46.35,76.67
  Bottom 0.254: v94.61,71.59 90.8,75.4 84.45,75.4 81.91,77.94 v76.83,77.94 | v65.4,83.02 v52.7,83.02 | v46.35,76.67 45.08,75.4 40,75.4 38.73,76.67 IC1.4
N$28  (via drill 0.61)
  Top 0.254: LED5.A 102.23,8.09 v102.23,43.65 | v66.67,61.43 v66.67,69.05 | v47.62,69.05 47.62,74.13 46.35,75.4 43.81,75.4 43.81,74.13 IC1.12
  Bottom 0.254: v102.23,43.65 90.8,55.08 73.02,55.08 v66.67,61.43 | v66.67,69.05 v47.62,69.05
N$29
  Bottom 0.254: R6.2 108.58,5.55 LED5.K
N$30  (1 unrouted)
N$31
  Bottom 0.254: R5.2 118.74,5.55 LED6.K
N$32  (via drill 0.61)
  Top 0.254: v37.46,60.16 37.46,67.78 36.19,69.05 IC1.7 | v57.78,60.16 64.13,66.51 64.13,79.21 v66.67,81.75
  Bottom 0.254: v37.46,60.16 v57.78,60.16 | v66.67,81.75 SV4.4
N$33  (via drill 0.61)
  Top 0.254: v37.46,84.29 37.46,75.4 36.19,74.13 IC1.5
  Bottom 0.254: v37.46,84.29 38.73,85.56 59.05,85.56 60.32,84.29 SV4.3
N$34  (via drill 0.61)
  Top 0.254: v53.97,74.13 v66.67,86.83
  Bottom 0.254: v53.97,74.13 51.43,71.59 IC1.11 | v66.67,86.83 SV4.2
N$35  (via drill 0.61)
  Top 0.254: v51.43,66.51 53.97,69.05 53.97,72.86 v69.21,88.1
  Bottom 0.254: v69.21,88.1 71.75,88.1 73.02,89.37 SV4.1 | IC1.9 v51.43,66.51
N$36
  Top 0.254: SV7.19 146.68,4.28 146.68,6.82 147.95,8.09 SV6.19
N$37
  Top 0.254: SV7.17 144.14,4.28 144.14,6.82 145.41,8.09 SV6.17
N$38
  Top 0.254: SV7.15 141.6,4.28 141.6,6.82 142.87,8.09 SV6.15
N$39
  Top 0.254: SV7.13 139.06,4.28 139.06,6.82 140.33,8.09 SV6.13
N$40
  Top 0.254: SV7.11 136.52,4.28 136.52,6.82 137.79,8.09 SV6.11
N$41
  Top 0.254: SV7.5 128.9,4.28 128.9,6.82 130.17,8.09 SV6.5
N$42
  Top 0.254: SV7.9 133.98,4.28 133.98,6.82 135.25,8.09 SV6.9
N$43
  Top 0.254: SV7.7 131.44,4.28 131.44,6.82 132.71,8.09 SV6.7
N$44
  Top 0.254: SV7.3 126.36,4.28 126.36,9.36 SV6.3
N$45
  Top 0.254: SV7.1 123.82,4.28 123.82,9.36 SV6.1
N$46
  Top 0.254: SV7.20 149.22,6.82 149.22,11.9 SV6.20
N$47
  Top 0.254: SV7.18 145.41,6.82 146.68,8.09 146.68,11.9 SV6.18
N$48
  Top 0.254: SV7.16 142.87,6.82 144.14,8.09 144.14,11.9 SV6.16
N$49
  Top 0.254: SV7.14 140.33,6.82 141.6,8.09 141.6,11.9 SV6.14
N$50
  Top 0.254: SV7.12 137.79,6.82 139.06,8.09 139.06,11.9 SV6.12
N$51
  Top 0.254: SV7.10 135.25,6.82 136.52,8.09 136.52,11.9 SV6.10
N$52
  Top 0.254: SV7.8 132.71,6.82 133.98,8.09 133.98,11.9 SV6.8
N$53
  Top 0.254: SV7.6 130.17,6.82 131.44,8.09 131.44,11.9 SV6.6
N$54
  Top 0.254: SV7.4 127.63,6.82 128.9,8.09 128.9,11.9 SV6.4
N$55
  Bottom 0.254: SV7.2 121.28,9.36 121.28,13.17 SV6.2
VCC  (via drill 0.61)
  Top 0.254: LED1.A 156.84,14.44 102.23,69.05 102.23,90.64 100.96,91.91 U$2.1 | 80.64,83.02 80.64,75.4 76.83,75.4 75.56,76.67 75.56,77.94 73.02,77.94 65.4,70.32 65.4,61.43 IC2.24 | 80.64,83.02 81.91,84.29 SV5.2 | v29.84,14.44 v29.84,28.41 v29.84,63.97 | C5.1 37.46,14.44 36.19,13.17 IC5.6 | v20.95,63.97 C4.1 | v12.06,63.97 10.79,65.24 10.79,85.56 | 10.79,85.56 C8.+ | 10.79,85.56 5.71,85.56 U$1.1 | 80.64,83.02 70.48,83.02 70.48,88.1 69.21,89.37 61.59,89.37 C1.1
  Bottom 0.254: IC6.6 19.68,13.17 20.95,14.44 v29.84,14.44 32.38,14.44 33.65,13.17 IC5.6 | C2.1 22.22,28.41 v29.84,28.41 | v12.06,63.97 v20.95,63.97 v29.84,63.97 | 19.68,89.37 C6.1 | 19.68,89.37 12.06,89.37 C8.+ | 36.19,89.37 C3.1 | 19.68,89.37 36.19,89.37 | C1.1 42.54,88.1 41.27,89.37 36.19,89.37 | U$2.1 90.8,90.64 90.8,85.56 88.26,85.56 86.99,84.29 SV5.2
VDD  (via drill 0.61)
  Top 0.254: v13.33,58.89 v13.33,80.48 | v32.38,29.68 v32.38,53.81
  Bottom 0.254: 32.38,27.14 40,27.14 41.27,25.87 IC5.16 | 32.38,27.14 28.57,27.14 27.3,25.87 IC6.16 | v13.33,58.89 17.14,55.08 IC3.1 19.68,55.08 20.95,53.81 v32.38,53.81 | v13.33,80.48 17.14,84.29 IC4.1 19.68,84.29 20.95,85.56 32.38,85.56 33.65,84.29 IC1.1 | 32.38,27.14 v32.38,29.68
VSS
  Top 0.254: 15.87,36.03 15.87,9.36 17.14,8.09 IC6.8 | 15.87,36.03 17.14,37.3 IC3.8 | 15.87,36.03 15.87,56.35 17.14,57.62 17.14,66.51 IC4.8
  Bottom 0.254: IC4.8 19.68,66.51 20.95,65.24 28.57,65.24 29.84,66.51 IC1.8 | IC5.8 29.84,8.09 28.57,9.36 23.49,9.36 22.22,8.09 IC6.8